# Altium schematic sheet Power.SchDoc
size B; SheetNumber: 3; SheetTotal: 6
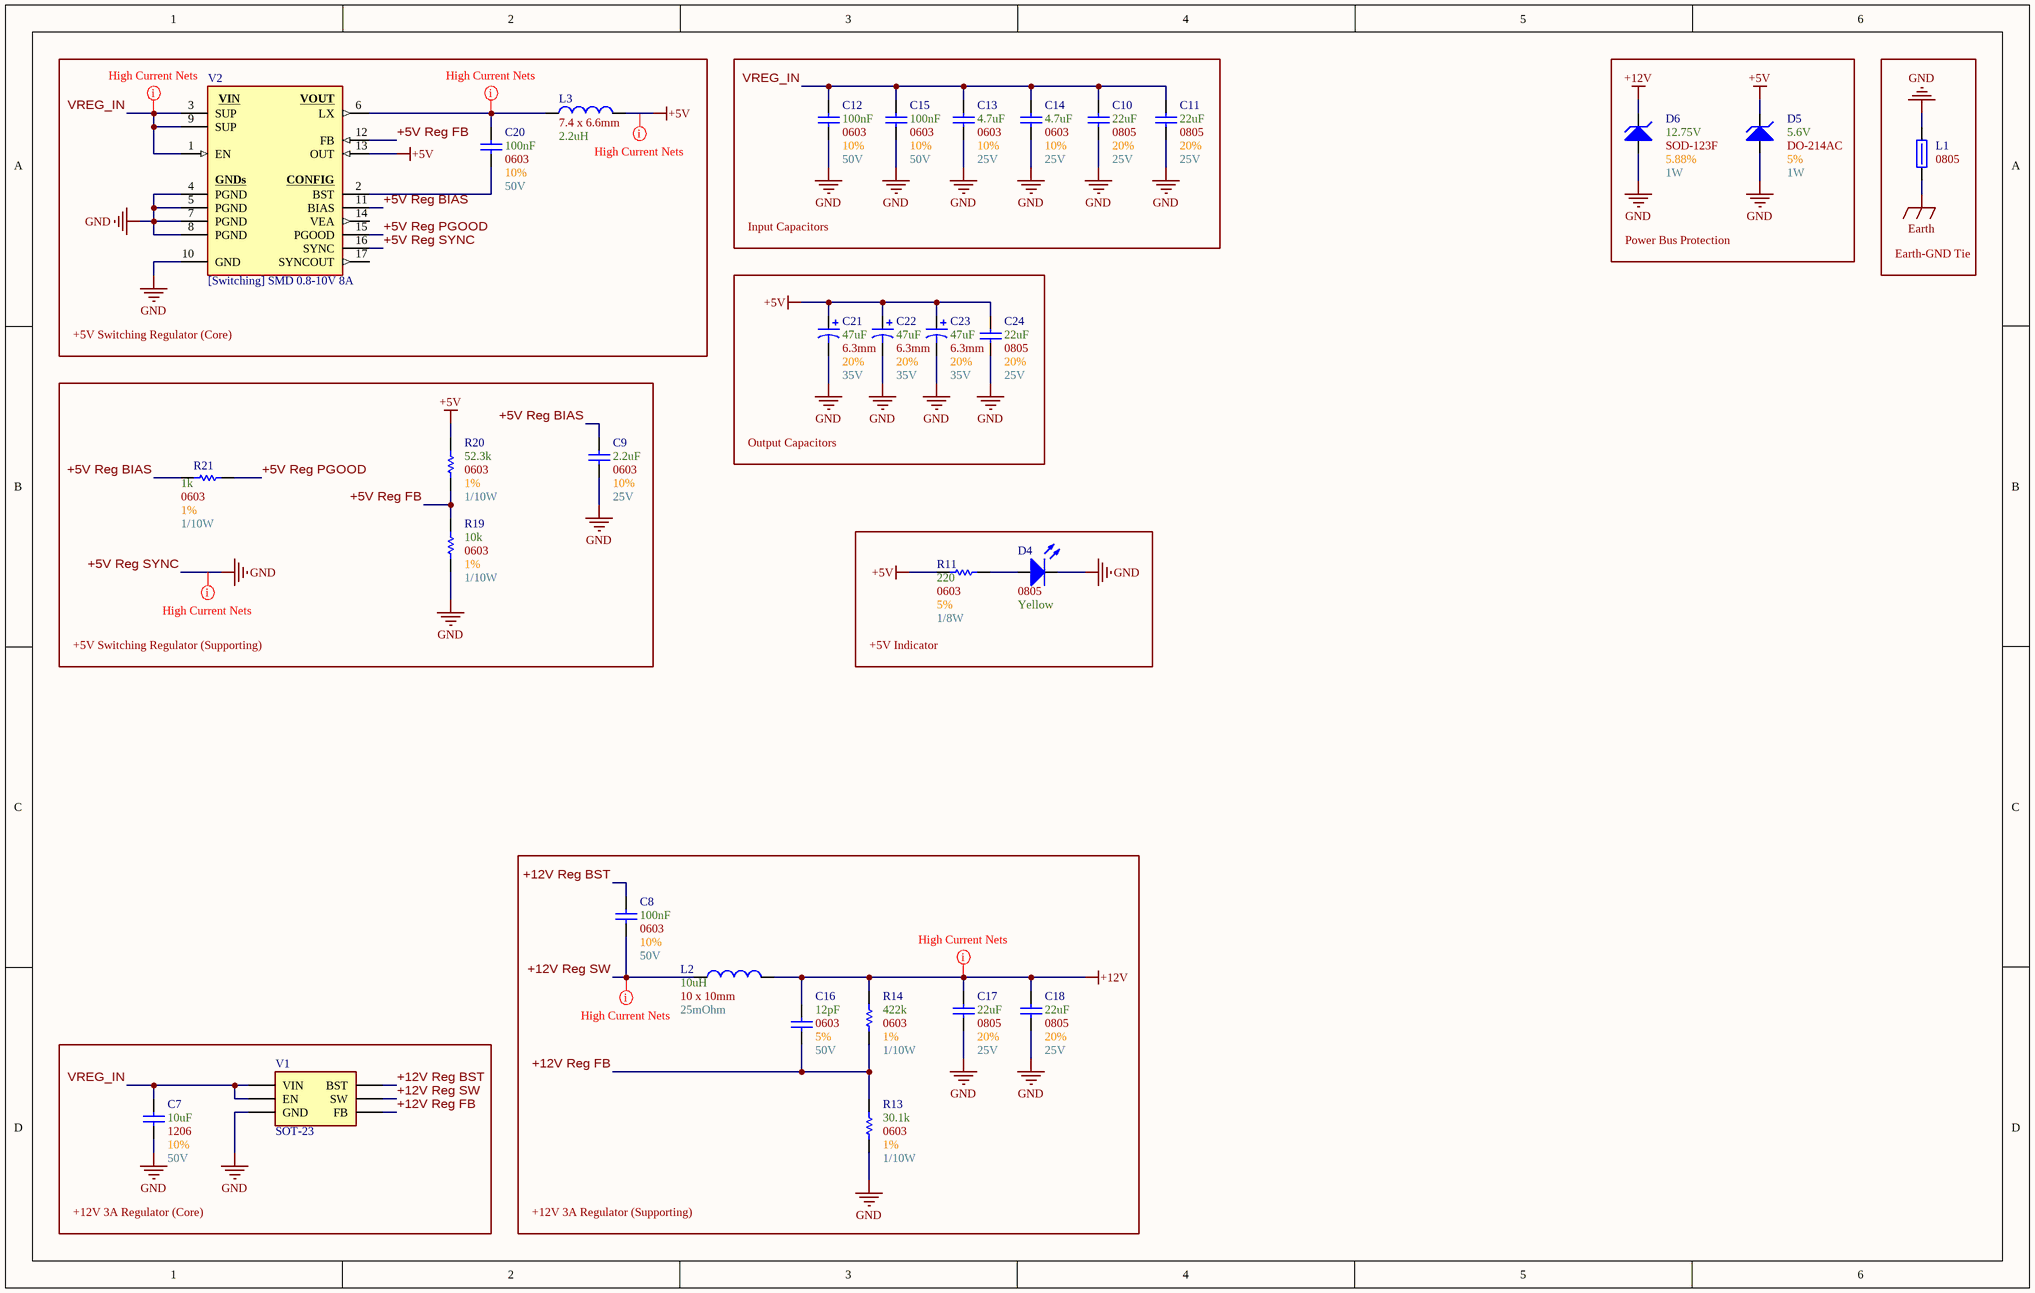
[diagram p0: Power.SchDoc]

## Parts
C7  Max Voltage: 50V  Size Package: 1206  Tolerance: 10%  Capacitance: 10uF  [[Cap] SMD 1206]  (hidden comment: [Cap] 1206 10uF 20% 50V)
C8  Max Voltage: 50V  Size Package: 0603  Tolerance: 10%  Capacitance: 100nF  [[Cap] SMD 0603]  (hidden comment: [Cap] 0603 0.1uF 10% 50V)
C9  Max Voltage: 25V  Size Package: 0603  Tolerance: 10%  Capacitance: 2.2uF  [[Cap] SMD 0603]  (hidden comment: [Cap] 0603 2.2uF 10% 25V)
C10  Max Voltage: 25V  Size Package: 0805  Tolerance: 20%  Capacitance: 22uF  [[Cap] SMD 0805]  (hidden comment: [Cap] 0805 22uF 20% 25V)
C11  Max Voltage: 25V  Size Package: 0805  Tolerance: 20%  Capacitance: 22uF  [[Cap] SMD 0805]  (hidden comment: [Cap] 0805 22uF 20% 25V)
C12  Max Voltage: 50V  Size Package: 0603  Tolerance: 10%  Capacitance: 100nF  [[Cap] SMD 0603]  (hidden comment: [Cap] 0603 0.1uF 10% 50V)
C13  Max Voltage: 25V  Size Package: 0603  Tolerance: 10%  Capacitance: 4.7uF  [[Cap] SMD 0603]  (hidden comment: [Cap] 0603 4.7uF 10% 25V)
C14  Max Voltage: 25V  Size Package: 0603  Tolerance: 10%  Capacitance: 4.7uF  [[Cap] SMD 0603]  (hidden comment: [Cap] 0603 4.7uF 10% 25V)
C15  Max Voltage: 50V  Size Package: 0603  Tolerance: 10%  Capacitance: 100nF  [[Cap] SMD 0603]  (hidden comment: [Cap] 0603 0.1uF 10% 50V)
C16  Max Voltage: 50V  Size Package: 0603  Tolerance: 5%  Capacitance: 12pF  [[Cap] SMD 0603]  (hidden comment: [Cap] 0603 12pF 5% 50V)
C17  Max Voltage: 25V  Size Package: 0805  Tolerance: 20%  Capacitance: 22uF  [[Cap] SMD 0805]  (hidden comment: [Cap] 0805 22uF 20% 25V)
C18  Max Voltage: 25V  Size Package: 0805  Tolerance: 20%  Capacitance: 22uF  [[Cap] SMD 0805]  (hidden comment: [Cap] 0805 22uF 20% 25V)
C20  Max Voltage: 50V  Size Package: 0603  Tolerance: 10%  Capacitance: 100nF  [[Cap] SMD 0603]  (hidden comment: [Cap] 0603 0.1uF 10% 50V)
C21  Max Voltage: 35V  Size Package: 6.3mm  Tolerance: 20%  Capacitance: 47uF  [[Cap] SMD Polarized, 6.3mm]  (hidden comment: [Cap] 6.3mm 47uF 20% 35V)
C22  Max Voltage: 35V  Size Package: 6.3mm  Tolerance: 20%  Capacitance: 47uF  [[Cap] SMD Polarized, 6.3mm]  (hidden comment: [Cap] 6.3mm 47uF 20% 35V)
C23  Max Voltage: 35V  Size Package: 6.3mm  Tolerance: 20%  Capacitance: 47uF  [[Cap] SMD Polarized, 6.3mm]  (hidden comment: [Cap] 6.3mm 47uF 20% 35V)
C24  Max Voltage: 25V  Size Package: 0805  Tolerance: 20%  Capacitance: 22uF  [[Cap] SMD 0805]  (hidden comment: [Cap] 0805 22uF 20% 25V)
D4  Color: Yellow  Size Package: 0805  [[LED] SMD 0805]  (hidden comment: [LED] SMD 0805 Yellow)
D5  Tolerance: 5%  Wattage: 1W  Optimal Zener Voltage: 5.6V  [[Diode] SMD DO-214AC]  (hidden comment: DO-214AC)
D6  Tolerance: 5.88%  Wattage: 1W  Optimal Zener Voltage: 12.75V  [[Diode] SOD-123F]  (hidden comment: SOD-123F)
L1  Size Package: 0805  [[Ferrite] SMD 0805]  (hidden comment: 652-MH2029-300Y)
L2  DC Resistance: 25mOhm  Package: 10 x 10mm  Inductance: 10uH  [[10uH] SMD Nonstandard 3.8A]  (hidden comment: [10uH] SMD Nonstandard 3.8A)
L3  Package: 7.4 x 6.6mm  Inductance: 2.2uH  [[Inductor] SMD 7.4 X 6.6 X 3 MM]  (hidden comment: [2.2uH] SMD Nonstandard 10A)
R11  Wattage: 1/8W  Tolerance: 5%  Resistance: 220  Size Package: 0603  [[Res] SMD 0603]  (hidden comment: [220] SMD 0603 5% 1/10W)
R13  Wattage: 1/10W  Tolerance: 1%  Resistance: 30.1k  Size Package: 0603  [[Res] SMD 0603]  (hidden comment: [30.1k] SMD 0603 1% 1/10W)
R14  Wattage: 1/10W  Tolerance: 1%  Resistance: 422k  Size Package: 0603  [[Res] SMD 0603]  (hidden comment: [422k] SMD 0603 1% 1/10W)
R19  Wattage: 1/10W  Tolerance: 1%  Resistance: 10k  Size Package: 0603  [[Res] SMD 0603]  (hidden comment: [10k] SMD 0603 1% 1/8W)
R20  Wattage: 1/10W  Tolerance: 1%  Resistance: 52.3k  Size Package: 0603  [[Res] SMD 0603]  (hidden comment: [52.3k] SMD 0603 1% 1/10W)
R21  Wattage: 1/10W  Tolerance: 1%  Resistance: 1k  Size Package: 0603  [[Res] SMD 0603]  (hidden comment: [1k] SMD 0603 1% 1/10W)
V1  SOT-23  [SOT-23]
V2  [Switching] SMD 0.8-10V 8A  [[Switching] 17-PowerWFQFN]

## Blocks framed on the sheet
+5V Switching Regulator (Core): C20 L3 V2
Input Capacitors: C10-C15
Power Bus Protection: D5 D6
Earth-GND Tie: L1
Output Capacitors: C21-C24
+5V Switching Regulator (Supporting): C9 R19-R21
+5V Indicator: D4 R11
+12V 3A Regulator (Supporting): C8 C16-C18 L2 R13 R14
+12V 3A Regulator (Core): C7 V1

## Nets
+5V: C21.1 C22.1 C23.1 C24.2 D5.1(K) L3.2 R11.1 R20.2 V2.13(OUT)
+5V Reg SYNC: C7.1 C9.1 C10.1 C11.1 C12.1 C13.1 C14.1 C15.1 C17.1 C18.1 C21.2 C22.2 C23.2 C24.1 D4.2(Cathode) D5.2(A) D6.2(A) L1.2 R13.1 R19.1 V1.4(GND) V2.4(PGND) V2.5(PGND) V2.7(PGND) V2.8(PGND) V2.10(GND) V2.16(SYNC)  [also labelled GND]
+12V: C16.2 C17.2 C18.2 D6.1(K) L2.2 R14.2
Earth: L1.1
+5V Reg BIAS: C9.2 R21.1 V2.11(BIAS)
+5V Reg FB: R19.2 R20.1 V2.12(FB)
+5V Reg PGOOD: R21.2 V2.15(PGOOD)
+12V Reg BST: C8.2 V1.6(BST)
+12V Reg FB: C16.1 R13.2 R14.1 V1.1(FB)
+12V Reg SW: C8.1 L2.1 V1.5(SW)
VREG_IN: C7.2 C10.2 C11.2 C12.2 C13.2 C14.2 C15.2 V1.2(EN) V1.3(VIN) V2.1(EN) V2.3(SUP) V2.9(SUP)
NetC20_1: C20.1 V2.2(BST)
NetC20_2: C20.2 L3.1 V2.6(LX)
NetD4_1: D4.1(Anode) R11.2

Not connected (* = marked no-connect by the designer): V2 14(VEA) 17(SYNCOUT)

## Layout directives
net class High_Current_Nets: +5V, +5V Reg SYNC, +12V, +12V Reg SW, NetC20_2, VREG_IN

## Notes on the sheet
- (in symbol [Switching] SMD 0.8-10V 8A) VIN; VOUT; GNDs; CONFIG

## Library data of the parts
C7 = [Cap] 1206 10uF 20% 50V: CGA5L3X5R1H106M160AB; Supplier 1: DigiKey; Supplier Part Number 1: 445-12883-6-ND
C8 C12 C15 C20 = [Cap] 0603 0.1uF 10% 50V: CL10B104KB8NNNC; Supplier 1: DigiKey; Supplier Part Number 1: 1276-1000-6-ND
C9 = [Cap] 0603 2.2uF 10% 25V: GRM188R61E225KA12D; Supplier 1: DigiKey; Supplier Part Number 1: 490-10731-1-ND
C10 C11 C17 C18 C24 = [Cap] 0805 22uF 20% 25V: CL21A226MAYNNWE; Supplier 1: DigiKey; Supplier Part Number 1: 1276-CL21A226MAYNNWECT-ND
C13 C14 = [Cap] 0603 4.7uF 10% 25V: GRM188R61E475KE11D; Supplier 1: DigiKey; Supplier Part Number 1: 490-7203-6-ND
C16 = [Cap] 0603 12pF 5% 50V: C0603C120J5GACTU; Supplier 1: DigiKey; Supplier Part Number 1: 399-C0603C120J5GACTUCT-ND
C21-C23 = [Cap] 6.3mm 47uF 20% 35V: UWT1V470MCL1GS; Supplier 1: DigiKey; Supplier Part Number 1: 493-2202-1-ND
D4 = [LED] SMD 0805 Yellow: LY R976-PS-36-0-20-R18; Supplier 1: DigiKey; Supplier Part Number 1: 475-LYR976-PS-36-0-20-R18CT-ND
D5 = [Zener] SMD 5.6V 1W 5%: SMAZ5V6-13-F; Supplier 1: DigiKey; Supplier Part Number 1: SMAZ5V6-FDICT-ND; Footprint: DO-214AC
D6 = [Zener] SMD 12.75V 1W 5.88%: KDZVTR12B; Supplier 1: DigiKey; Supplier Part Number 1: KDZVTR12BCT-ND; Footprint: SOD-123F
L1 = [Ferrite] SMD 0805 3A 30ohm: Res @ Freq: 30 @ 100MHz; Supplier 1: DigiKey; Supplier Part Number 1: MH2029-300YCT-ND
L2 = [10uH] SMD Nonstandard 3.8A: SRU1038-100Y; Supplier 1: DigiKey; Supplier Part Number 1: SRU1038-100YCT-ND
L3 = [2.2uH] SMD Nonstandard 10A: ECS-MPIL0630-2R2MC; Supplier 1: DigiKey; Supplier Part Number 1: XC2402CT-ND
R11 = [220] SMD 0603 5% 1/10W: RK73B1JTTD221J; Supplier 1: DigiKey; Supplier Part Number 1: 2019-RK73B1JTTD221JDKR-ND
R13 = [30.1k] SMD 0603 1% 1/10W: RC0603FR-0730K1L; Supplier 1: DigiKey; Supplier Part Number 1: 311-30.1KHRCT-ND
R14 = [422k] SMD 0603 1% 1/10W: ERJ-3EKF4223V; Supplier 1: DigiKey; Supplier Part Number 1: P422KHDKR-ND
R19 = [10k] SMD 0603 1% 1/8W: RMCF0603FT10K0; Supplier 1: DigiKey; Supplier Part Number 1: RMCF0603FT10K0DKR-ND
R20 = [52.3k] SMD 0603 1% 1/10W: RC0603FR-0752K3L; Supplier 1: DigiKey; Supplier Part Number 1: 311-52.3KHRCT-ND
R21 = [1k] SMD 0603 1% 1/10W: RMCF0603FT1K00; Supplier 1: DigiKey; Supplier Part Number 1: RMCF0603FT1K00DKR-ND
V1 = [Switching] SMD 0.8-31V 3A: AP63301WU-7; Supplier 1: DigiKey; Supplier Part Number 1: 31-AP63301WU-7CT-ND
V2 = [Switching] SMD 0.8-10V 8A: MAX20408AFOF/VY+; Supplier 1: DigiKey; Supplier Part Number 1: 505-MAX20408AFOF/VY+-ND